# Altium schematic sheet LLR-05U (Secondary-Board-Schematic).SchDoc
size A4; SheetNumber: 1; SheetTotal: 1
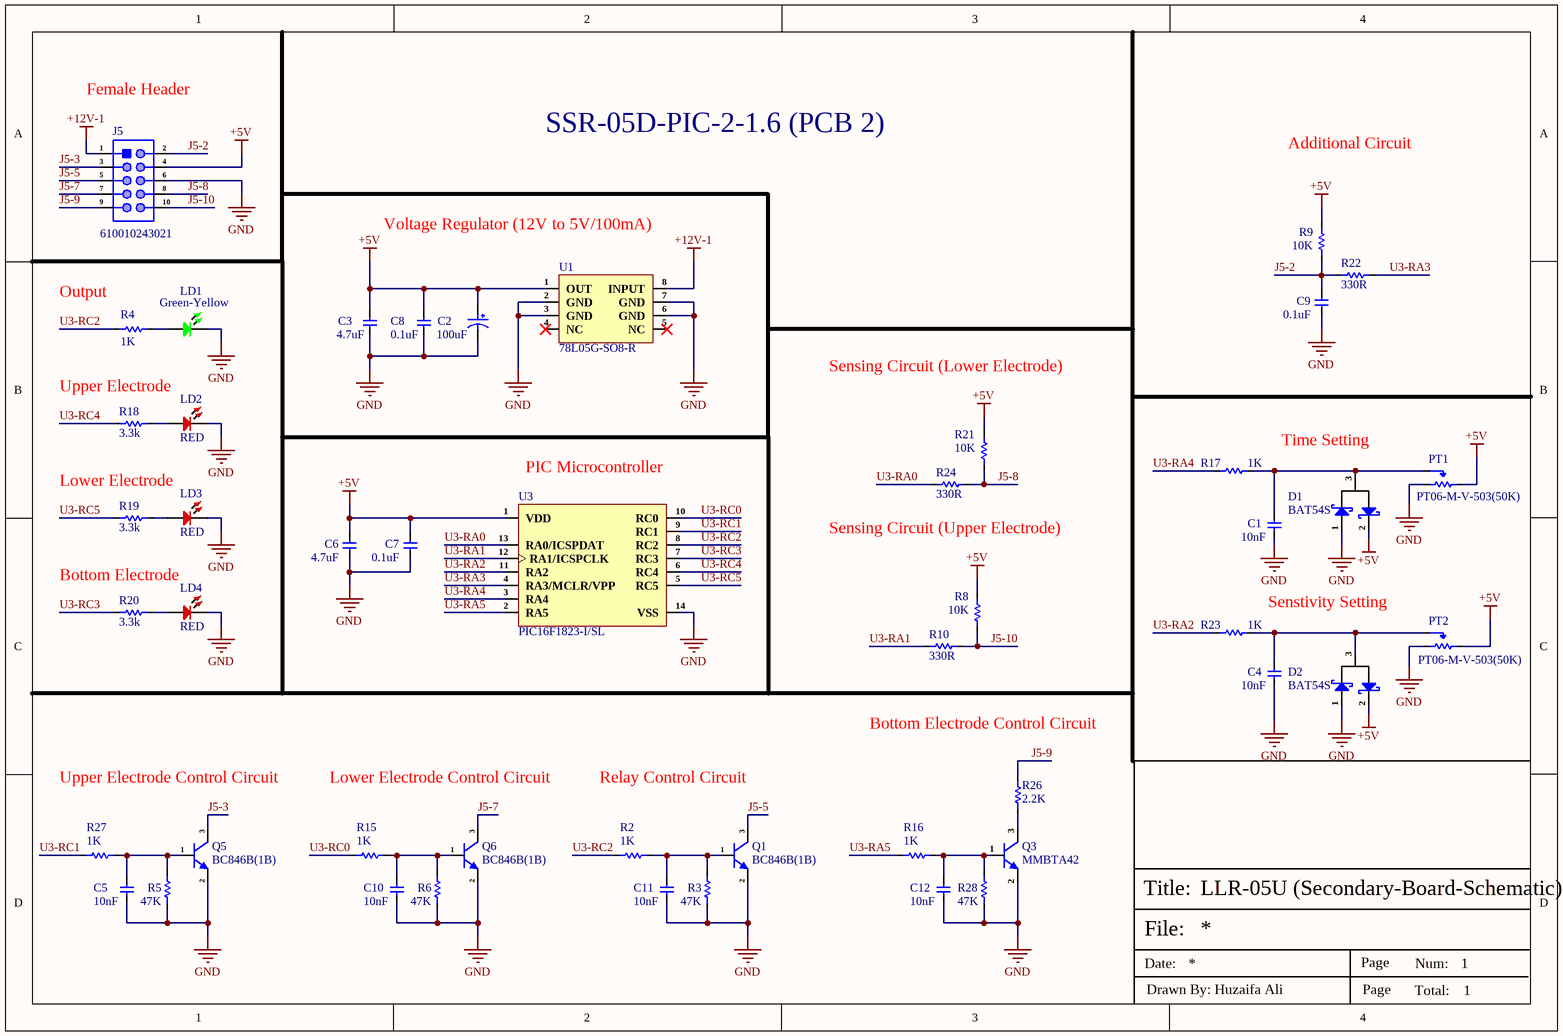
[diagram p0: LLR-05U (Secondary-Board-Schematic).SchDoc]

## Parts
C1  10nF  [Cap-0402]
C2  100uF  [RVT1A101M0605]
C3  4.7uF  [Cap-0603]
C4  10nF  [Cap-0402]
C5  10nF  [Cap-0402]
C6  4.7uF  [Cap-0603]
C7  0.1uF  [Cap-0603]
C8  0.1uF  [Cap-0603]
C9  0.1uF  [Cap-0603]
C10  10nF  [Cap-0402]
C11  10nF  [Cap-0402]
C12  10nF  [Cap-0402]
D1  BAT54S  [SOT-23]
D2  BAT54S  [SOT-23]
J5  610010243021  [610010243021]
LD1  Green-Yellow  [LED-0805]
LD2  RED  [LED-0805]
LD3  RED  [LED-0805]
LD4  RED  [LED-0805]
PT1  PT06-M-V-503(50K)  [PT06-M-V-503(50K)]
PT2  PT06-M-V-503(50K)  [PT06-M-V-503(50K)]
Q1  BC846B(1B)  [SOT-23]
Q3  MMBTA42  [SOT-23]
Q5  BC846B(1B)  [SOT-23]
Q6  BC846B(1B)  [SOT-23]
R2  1K  [Res-0603]
R3  47K  [Res-0603]
R4  1K  [Res-0603]
R5  47K  [Res-0603]
R6  47K  [Res-0603]
R8  10K  [Res-0603]
R9  10K  [Res-0603]
R10  330R  [Res-0603]
R15  1K  [Res-0603]
R16  1K  [Res-0603]
R17  1K  [Res-0603]
R18  3.3k  [Res-0603]
R19  3.3k  [Res-0603]
R20  3.3k  [Res-0603]
R21  10K  [Res-0603]
R22  330R  [Res-0603]
R23  1K  [Res-0603]
R24  330R  [Res-0603]
R26  2.2K  [Res-1206]
R27  1K  [Res-0603]
R28  47K  [Res-0603]
U1  78L05G-SO8-R  [SOP-8]
U3  PIC16F1823-I/SL  [SOIC-14]

## Nets
+5V: C2.1 C3.2 C6.2 C7.2 C8.2 D1.2(K) D2.2(K) J5.4 PT1.3(CW) PT2.3(CW) R8.2 R9.2 R21.2 U1.1(OUT) U3.1(VDD)
+12V-1: J5.1 U1.8(INPUT)
GND: C1.1 C2.2 C3.1 C4.1 C5.1 C6.1 C7.1 C8.1 C9.1 C10.1 C11.1 C12.1 D1.1(A) D2.1(A) J5.6 LD1.2 LD2.2 LD3.2 LD4.2 PT1.1(CCW) PT2.1(CCW) Q1.2(E) Q3.2(E) Q5.2(E) Q6.2(E) R3.1 R5.1 R6.1 R28.1 U1.2(GND) U1.3(GND) U1.6(GND) U1.7(GND) U3.14(VSS)
J5-2: C9.2 J5.2 R9.1 R22.2
J5-3: J5.3 Q5.3(C)
J5-5: J5.5 Q1.3(C)
J5-7: J5.7 Q6.3(C)
J5-8: J5.8 R21.1 R24.2
J5-9: J5.9 R26.2
J5-10: J5.10 R8.1 R10.2
U3-RA0: R24.1 U3.13(RA0/ICSPDAT)
U3-RA1: R10.1 U3.12(RA1/ICSPCLK)
U3-RA2: R23.2 U3.11(RA2)
U3-RA3: R22.1 U3.4(RA3/MCLR/VPP)
U3-RA4: R17.2 U3.3(RA4)
U3-RA5: R16.2 U3.2(RA5)
U3-RC0: R15.2 U3.10(RC0)
U3-RC1: R27.2 U3.9(RC1)
U3-RC2: R2.2 R4.2 U3.8(RC2)
U3-RC3: R20.1 U3.7(RC3)
U3-RC4: R18.1 U3.6(RC4)
U3-RC5: R19.1 U3.5(RC5)
NetC1_2: C1.2 D1.3(A/K) PT1.2(Wiper) R17.1
NetC4_2: C4.2 D2.3(A/K) PT2.2(Wiper) R23.1
NetC5_2: C5.2 Q5.1(B) R5.2 R27.1
NetC10_2: C10.2 Q6.1(B) R6.2 R15.1
NetC11_2: C11.2 Q1.1(B) R2.1 R3.2
NetC12_2: C12.2 Q3.1(B) R16.1 R28.2
NetLD1_1: LD1.1 R4.1
NetLD2_1: LD2.1 R18.2
NetLD3_1: LD3.1 R19.2
NetLD4_1: LD4.1 R20.2
NetQ3_3: Q3.3(C) R26.1

Not connected (* = marked no-connect by the designer): U1 4(NC)* 5(NC)*

## Notes on the sheet
- Female Header
- SSR-05D-PIC-2-1.6 (PCB 2)
- Additional Circuit
- Voltage Regulator (12V to 5V/100mA)
- (near R4) Output
- Sensing Circuit (Lower Electrode)
- Upper Electrode
- Time Setting
- Lower Electrode
- (near U3) PIC Microcontroller
- Bottom Electrode
- Sensing Circuit (Upper Electrode)
- Senstivity Setting
- Upper Electrode Control Circuit
- Lower Electrode Control Circuit
- Relay Control Circuit
- Bottom Electrode Control Circuit
- File:
- Title:
- Date:
- Page
- Num:
- Total:
- Drawn By: Huzaifa Ali

## Library data of the parts
C1 C4 C5 C10-C12 = CC0402KRX7R8BB103: CAP CER 10000PF 25V X7R 0402; Manufacturer: Yageo; Tolerance: 10%; Item Type: Capacitor; Supplier 1: Digi-Key; Manufacturer Part Number: CC0402KRX7R8BB103; Stock 1: 0; Pricing 1: 1=0.1, 10=0.021, 100=0.0093, 500=0.00666, 1000=0.00523, 2500=0.00476, 5000=0.00438 (USD); Mount: Surface Mount; Case/Package: 0402; Case Code (Metric): 1005; Case Code (Imperial): 0402; Min Operating Temperature: -55°C; Max Operating Temperature: 125°C; Capacitance: 10nF; Dielectric: X7R; Voltage Rating: 25V; Package Quantity: 1; Packaging: Tape and Reel; Voltage Rating (DC): 25V; Termination: SMD/SMT; Composition: Ceramic; Length: 1mm; Height: 0.5mm; Depth: 0.5mm; Width: 0.02inch; Thickness: 0.022inch; Radiation Hardening: No; REACH SVHC: Unknown; Lead Free: Lead Free; Halogen Free: Halogen Free; ComponentLink1URL: http://www.yageo.com/documents/recent/UPY-GPHC_X7R_6.3V-to-50V_18.pdf?src-supplier=Digi-Key; ComponentLink1Description: http://www.yageo.com/documents/recent/UPY-GPHC_X7R_6.3V-to-50V_18.pdf?src-supplier=Digi-Key; ComponentLink2URL: https://www.verical.com/server-webapp/html/getDatasheet?partID=375418&src-supplier=Verical; ComponentLink2Description: https://www.verical.com/server-webapp/html/getDatasheet?partID=375418&src-supplier=Verical; ComponentLink3URL: http://www.yageo.com/documents/recent/UPY-GPHC_X7R_6.3V-to-50V_8.pdf?src-supplier=Avnet; ComponentLink3Description: http://www.yageo.com/documents/recent/UPY-GPHC_X7R_6.3V-to-50V_8.pdf?src-supplier=Avnet; ComponentLink4URL: https://4donline.ihs.com/images/VipMasterIC/IC/YAGO/YAGO-S-A0003557223/YAGO-S-A0003557223-1.pdf?hkey=52A5661711E402568146F3353EA87419&src-supplier=Element14; ComponentLink4Description: https://4donline.ihs.com/images/VipMasterIC/IC/YAGO/YAGO-S-A0003557223/YAGO-S-A0003557223-1.pdf?hkey=52A5661711E402568146F3353EA87419&src-supplier=Element14; ComponentLink5URL: http://www.farnell.com/datasheets/2167236.pdf?src-supplier=Element14; ComponentLink5Description: http://www.farnell.com/datasheets/2167236.pdf?src-supplier=Element14; ComponentLink6URL: http://www.mouser.com/ds/2/447/Yageo_UPY-GP_NP0_16V-to-50V_9-358835.pdf?src-supplier=Mouser; ComponentLink6Description: http://www.mouser.com/ds/2/447/Yageo_UPY-GP_NP0_16V-to-50V_9-358835.pdf?src-supplier=Mouser; Supplier Part Number 1: 311-1337-1-ND; LCSC Part Number: C327025
C2 = RVT1A101M0605: 100uF 10V 55mA@120Hz ±20% SMD,D6.3xL5.4mm Aluminum Electrolytic Capacitors - SMD ROHS; Manufacturer: ROQANG; Manufacturer Part Number: RVT1A101M0605; Package: SMD,D6.3xL5.4mm; LCSC Part Number: C72474; Item Type: Capacitor; ComponentLink1Description: LCSC; ComponentLink1URL: https://www.lcsc.com/product-detail/Aluminum-Electrolytic-Capacitors-SMD_ROQANG-RVT1A101M0605_C72474.html
C3 C6 = GRM188R61E475KE11D: CAP CER 4.7UF 25V X5R 0603; Manufacturer: Murata; Material: Ceramic; Tolerance: 10%; Supplier 1: Digi-Key; Manufacturer Part Number: GRM188R61E475KE11D; Stock 1: 71618; Pricing 1: 1=0.37, 10=0.258, 100=0.1549, 500=0.1162, 1000=0.09812 (USD); Mount: Surface Mount; Case/Package: 0603; Case Code (Metric): 1608; Case Code (Imperial): 0603; Min Operating Temperature: -55°C; Max Operating Temperature: 85°C; Package Quantity: 4000; Packaging: Cut Tape; Capacitance: 4.7uF; Voltage Rating: 25V; Dielectric: X5R; Voltage: 25V; Voltage Rating (DC): 25V; Length: 1.6mm; Height: 0.8mm; Width: 0.031inch; Thickness: 0.031inch; Depth: 0.8mm; REACH SVHC: No SVHC; Lead Free: Lead Free; ComponentLink1URL: http://www.farnell.com/datasheets/2048165.pdf?src-supplier=Element14; ComponentLink1Description: http://www.farnell.com/datasheets/2048165.pdf?src-supplier=Element14; ComponentLink2URL: https://www.murata.com/~/media/webrenewal/support/library/catalog/products/capacitor/mlcc/c02e.ashx?la=en-us&src-supplier=Digi-Key; ComponentLink2Description: https://www.murata.com/~/media/webrenewal/support/library/catalog/products/capacitor/mlcc/c02e.ashx?la=en-us&src-supplier=Digi-Key; Supplier Part Number 1: 490-7203-1-ND; LCSC Part Number: C90057
C7-C9 = CL10B104KB8WPNC: CAP CER 0.1UF 50V X7R 0603; Item Type: Capacitor; Material: 4241ConductorMaterial; Value: 100nF; Tolerance: 10%; LCSC Part Number: C307348; ComponentLink1Description: LCSC; Supplier: Rs; Supplier Part Number: 2575919; RoHS: Yes; Category: Ceramic Capacitors; Stock: 400; Pricing: 100=0.021, 500=0.019, 1000=0.015, 2000=0.01 (GBP); Mounting Technology: Surface Mount; Case/Package: 0603; Case Code (Metric): 1608; Case Code (Imperial): 0603; Min Operating Temperature: -55°C; Max Operating Temperature: 125°C; Packaging: Cut Tape; Voltage Rating: 50V; Series: CL; Voltage Rating (DC): 50V; Height: 900um; Ratings: AEC-Q200; RoHS Compliant: Yes; Lead Free: 5697LeadFree; ComponentLink2URL: http://www.farnell.com/datasheets/2710560.pdf?src-supplier=Farnell; ComponentLink2Description: http://www.farnell.com/datasheets/2710560.pdf?src-supplier=Farnell; ComponentLink3URL: http://www.samsungsem.com/kr/support/product-search/mlcc/CL10B104KB8WPNC.jsp?src-supplier=Digi-Key; ComponentLink3Description: http://www.samsungsem.com/kr/support/product-search/mlcc/CL10B104KB8WPNC.jsp?src-supplier=Digi-Key; ComponentLink4URL: http://www.farnell.com/datasheets/2710560.pdf?src-supplier=Element14; ComponentLink4Description: http://www.farnell.com/datasheets/2710560.pdf?src-supplier=Element14; ComponentLink5URL: https://datasheet.octopart.com/CL10B104KB8WPNC-Samsung-Electro-Mechanics-datasheet-120093645.pdf?src-supplier=Future+Electronics; ComponentLink5Description: https://datasheet.octopart.com/CL10B104KB8WPNC-Samsung-Electro-Mechanics-datasheet-120093645.pdf?src-supplier=Future+Electronics; ComponentLink6URL: http://www.farnell.com/datasheets/2710560.pdf?src-supplier=Newark; ComponentLink6Description: http://www.farnell.com/datasheets/2710560.pdf?src-supplier=Newark; ComponentLink7URL: http://www.samsungsem.com/servlet/FileDownload?type=spec&file=CL10B104KB8WPNC.pdf&src-supplier=Avnet; ComponentLink7Description: http://www.samsungsem.com/servlet/FileDownload?type=spec&file=CL10B104KB8WPNC.pdf&src-supplier=Avnet; ComponentLink8URL: https://datasheet.octopart.com/CL10B104KB8WPNC-Samsung-datasheet-8326407.pdf?src-supplier=TME; ComponentLink8Description: https://datasheet.octopart.com/CL10B104KB8WPNC-Samsung-datasheet-8326407.pdf?src-supplier=TME
D1 D2 = BAT54S: 30V Dual 200mA 800mV@100mA SOT-23 Schottky Barrier Diodes (SBD) ROHS; Manufacturer: JSMSEMI; Item Type: Diode; Manufacturer Part Number: BAT54S; Package: SOT-23; LCSC Part Number: C916425; ComponentLink1Description: LCSC; ComponentLink1URL: https://www.lcsc.com/product-detail/Schottky-Barrier-Diodes-SBD_JSMSEMI-BAT54S_C916425.html
J5 = 610010243021: SMT Vertical Socket Header WR-PHD, Pitch 2.54 mm, Dual Row, 10 pins; Manufacturer: Wurth Electronics; Item Type: Female Header; Supplier: Farnell; Supplier Part Number: 2827934; Manufacturer Part Number: 610010243021; RoHS: Yes; Stock: 117; Pricing: 1=1.86, 10=1.41, 100=1.22, 250=1.12, 500=1.05, 1000=0.972 (GBP); RoHS Compliant: Yes; LCSC Part Number: C6848484
LD1 = XL-2012SYGC: 0805 普绿色 (Iv=26-75mcd(Typ) @IF=5mA); Manufacturer: XINGLIGHT; Item Type: LED; Supplier: LCSC; LCSC Part Number: C965816; Manufacturer Part Number: XL-2012SYGC; RoHS: No
LD2-LD4 = NCD0805R1: 20mA 无色透明透镜 67mcd~195mcd -30℃~+85℃ 615nm~630nm 独立二极管 Red 130° 65mW 1.6V~2.6V 0805 Light Emitting Diodes (LED) ROHS; Manufacturer: FOSHAN Nationstar Optoelectronics; Supplier: LCSC; LCSC Part Number: C84256; Manufacturer Part Number: NCD0805R1; RoHS: No; Item Type: LED
PT1 PT2 = PT06-M-V-503(50K): 20% 150mW 50kΩ - Variable Resistors/Potentiometers ROHS; Manufacturer: BOCHEN; Manufacturer Part Number: PT06-M-V-503(50K); Package: Custom; LCSC Part Number: C5205067; Item Type: Potentiometer; ComponentLink1Description: LCSC; ComponentLink1URL: https://www.lcsc.com/product-detail/Variable-span-style-background-color-ff0-Resistors-span-Potentiometers_BOCHEN-Chengdu-Guosheng-Tech-PT10-M-V-503-50K_C5205087.html
Q1 Q5 Q6 = BC846B(1B): 65V 300mW 200@2mA,5V 100mA NPN SOT-23 Bipolar Transistors - BJT ROHS; Manufacturer: ST(Semtech); Manufacturer Part Number: BC846B(1B); Package: SOT-23; LCSC Part Number: C118727; Item Type: Transistor; ComponentLink1Description: LCSC; ComponentLink1URL: https://www.lcsc.com/product-detail/Transistors-NPN-PNP_ST-Semtech-BC846B-1B_C118727.html
Q3 = MMBTA42: 300V 350mW 100@10mA,10V 300mA NPN SOT-23 Bipolar Transistors - BJT ROHS; Manufacturer: Guangdong Hottech; Manufacturer Part Number: MMBTA42; Package: SOT-23; LCSC Part Number: C181172; Item Type: Transistor; ComponentLink1Description: LCSC; ComponentLink1URL: https://www.lcsc.com/product-detail/Bipolar-Transistors-BJT_Guangdong-Hottech-MMBTA42_C181172.html
R2 R4 R15-R17 R23 R27 = RT0603BRD071KL: RES SMD 1K OHM 0.1% 1/10W 0603; Manufacturer: Yageo; Resistance: 1kR; Power Rating: 100mW; Voltage Rating: 75V; Temperature Coefficient: 25ppm/°C; Voltage Rating (DC): 50V; Item Type: Resistor; Supplier 1: Arrow Electronics; Manufacturer Part Number: RT0603BRD071KL; RoHS: Yes; Category: Chip SMD Resistors; Stock 1: 130000; Pricing 1: 5000=0.03900, 10000=0.03450, 25000=0.03070, 50000=0.02040 (USD); Mount: Surface Mount; Case/Package: 0603; Case Code (Metric): 1608; Case Code (Imperial): 0603; Contact Plating: Tin,Lead; Size Code: 0603; Min Operating Temperature: -55°C; Max Operating Temperature: 125°C; Package Quantity: 5000; Packaging: Tape and Reel; Resistor Type: Thin Film; Number of Terminations: 2; Termination: SMD/SMT; Max Power Dissipation: 100mW; Features: Moisture Resistant; Series: RT; Technology: THIN FILM; Construction: Rectangular; Length: 1.6mm; Width: 0.031inch; Height: 0.022inch; Depth: 0.8mm; Military Standard: Not; Lead Free: Lead Free; RoHS Compliant: Yes; ComponentLink1URL: https://datasheet.ciiva.com/11819/0900766b8079c86e-11819652.pdf?src-supplier=RSComponents; ComponentLink1Description: https://datasheet.ciiva.com/11819/0900766b8079c86e-11819652.pdf?src-supplier=RSComponents; ComponentLink2URL: https://datasheet.ciiva.com/5624/pyu-rt-1-to-0-05-rohs-l-4-5624759.pdf?src-supplier=Mouser; ComponentLink2Description: https://datasheet.ciiva.com/5624/pyu-rt-1-to-0-05-rohs-l-4-5624759.pdf?src-supplier=Mouser; ComponentLink3URL: https://datasheet.ciiva.com/29718/pyu-rt-1-to-0-05-rohs-l-4-29718010.pdf?src-supplier=Digi-Key; ComponentLink3Description: https://datasheet.ciiva.com/29718/pyu-rt-1-to-0-05-rohs-l-4-29718010.pdf?src-supplier=Digi-Key; ComponentLink4URL: https://datasheet.ciiva.com/29718/pyu-rt-1-to-0-05-rohs-l-4-29718011.pdf?src-supplier=Digi-Key; ComponentLink4Description: https://datasheet.ciiva.com/29718/pyu-rt-1-to-0-05-rohs-l-4-29718011.pdf?src-supplier=Digi-Key; Supplier Part Number 1: RT0603BRD071KL; LCSC Part Number: C110776
R3 R5 R6 R28 = RT0603BRD0747KL: RES SMD 47K OHM 0.1% 1/10W 0603; Manufacturer: Yageo; Voltage Rating: 75V; Resistance: 47kR; Power Rating: 100mW; Temperature Coefficient: 25ppm/°C; Voltage Rating (DC): 50V; Item Type: Resistor; Supplier 1: Arrow Electronics; Manufacturer Part Number: RT0603BRD0747KL; RoHS: Yes; Category: Chip SMD Resistors; Stock 1: 5153; Pricing 1: 1=0.29190, 10=0.22910, 25=0.22680, 100=0.09530, 250=0.09440, 500=0.09340, 1000=0.04780, 3000=0.03070 (USD); Case/Package: 0603; Case Code (Metric): 1608; Case Code (Imperial): 0603; Contact Plating: Tin,Lead; Min Operating Temperature: -55°C; Max Operating Temperature: 125°C; Packaging: Tape and Reel; Package Quantity: 5000; Resistor Type: Thin Film; Termination: SMD/SMT; Number of Terminations: 2; Max Power Dissipation: 100mW; Features: Moisture Resistant; Series: RT; Construction: Rectangular; Length: 0.063inch; Width: 0.031inch; Height: 0.022inch; Depth: 0.8mm; Military Standard: Not; Lead Free: Lead Free; RoHS Compliant: Yes; ComponentLink1URL: https://datasheet.ciiva.com/2585/pyu-rt-1-to-0-05-rohs-l-4-2585964.pdf?src-supplier=Digi-Key; ComponentLink1Description: https://datasheet.ciiva.com/2585/pyu-rt-1-to-0-05-rohs-l-4-2585964.pdf?src-supplier=Digi-Key; ComponentLink2URL: https://datasheet.ciiva.com/46635/pyu-rt-1-to-0-05-rohs-l-5-46635309.pdf?src-supplier=Digi-Key; ComponentLink2Description: https://datasheet.ciiva.com/46635/pyu-rt-1-to-0-05-rohs-l-5-46635309.pdf?src-supplier=Digi-Key; Supplier Part Number 1: RT0603BRD0747KL; LCSC Part Number: C326725
R8 R9 R21 = RC0603FR-0710KL: RES SMD 10K Ohm 1% 1/10W 0603; Manufacturer: Yageo; Resistance: 10kR; Temperature Coefficient: 100ppm/°C; Voltage Rating (DC): 50V; Power Rating: 100mW; Voltage Rating: 75V; Item Type: Resistor; Supplier 1: Digi-Key; Manufacturer Part Number: RC0603FR-0710KL; RoHS: Yes; Category: Chip SMD Resistors; Stock 1: 25249139; Pricing 1: 1=0.10000, 10=0.02400, 100=0.00970, 1000=0.00436, 2500=0.00378 (USD); Case/Package: 0603; Number of Pins: 2; Case Code (Imperial): 0603; Case Code (Metric): 1608; Weight: 7.1E-05oz; Size Code: 0603; Min Operating Temperature: -55°C; Max Operating Temperature: 155°C; Tolerance: 1%; Resistor Type: Thick Film; Packaging: Tape and Reel; Termination: SMD/SMT; Features: Moisture Resistant; Series: RC; Max Power Dissipation: 100mW; Number of Terminations: 2; Resistance Tolerance: 1%; Construction: Rectangular; Length: 1.6mm; Width: 0.8mm; Height: 0.45mm; Depth: 0.8mm; Lead Pitch: 0.3mm; REACH SVHC: Unknown; Lead Free: Lead Free; Military Standard: Not; RoHS Compliant: Yes; ComponentLink1URL: https://datasheet.ciiva.com/7660/38590-7660789.pdf?src-supplier=Element14; ComponentLink1Description: https://datasheet.ciiva.com/7660/38590-7660789.pdf?src-supplier=Element14; ComponentLink2URL: https://datasheet.ciiva.com/7983/443971-7983596.pdf?src-supplier=Element14; ComponentLink2Description: https://datasheet.ciiva.com/7983/443971-7983596.pdf?src-supplier=Element14; ComponentLink3URL: https://datasheet.ciiva.com/22747/443971-22747519.pdf?src-supplier=Element14; ComponentLink3Description: https://datasheet.ciiva.com/22747/443971-22747519.pdf?src-supplier=Element14; ComponentLink4URL: https://datasheet.ciiva.com/46440/1868787-46440891.pdf?src-supplier=Element14; ComponentLink4Description: https://datasheet.ciiva.com/46440/1868787-46440891.pdf?src-supplier=Element14; ComponentLink5URL: https://datasheet.ciiva.com/7746/1738695-7746239.pdf?src-supplier=Element14; ComponentLink5Description: https://datasheet.ciiva.com/7746/1738695-7746239.pdf?src-supplier=Element14; ComponentLink6URL: https://datasheet.ciiva.com/15189/getdatasheetpartid-409289-15189591.pdf?src-supplier=Verical; ComponentLink6Description: https://datasheet.ciiva.com/15189/getdatasheetpartid-409289-15189591.pdf?src-supplier=Verical; Supplier Part Number 1: 311-10.0KHRCT-ND; LCSC Part Number: C98220
R10 R22 R24 = 0603WAF3300T5E: 100mW Thick Film Resistors 75V ±100ppm/℃ ±1% 330Ω 0603 Chip Resistor - Surface Mount ROHS; Manufacturer: Royal Electronic Factory; Supplier: Mouser; Supplier Part Number: 303-0603WAF3300T5E; Manufacturer Part Number: 0603WAF3300T5E; RoHS: No; Item Type: Resistor; Stock: 210000; Pricing: 10000=0.001 (USD); Value: 330R; LCSC Part Number: C23138
R18-R20 = RT0603BRD073K3L: RES SMD 3.3K OHM 0.1% 1/10W 0603; Manufacturer: Yageo; Resistance: 3.3kR; Power Rating: 100mW; Voltage Rating: 75V; Temperature Coefficient: 25ppm/°C; Voltage Rating (DC): 50V; Item Type: Resistor; Supplier 1: Arrow Electronics; Manufacturer Part Number: RT0603BRD073K3L; RoHS: Yes; Category: Chip SMD Resistors; Stock 1: 2417; Pricing 1: 1=0.30610, 10=0.21080, 25=0.17430, 100=0.09180, 250=0.09000, 500=0.07600, 1000=0.04220 (USD); Case/Package: 0603; Case Code (Metric): 1608; Case Code (Imperial): 0603; Contact Plating: Tin,Lead; Min Operating Temperature: -55°C; Max Operating Temperature: 125°C; Package Quantity: 5000; Packaging: Tape and Reel; Tolerance: 0.1%; Resistor Type: Thin Film; Number of Terminations: 2; Termination: SMD/SMT; Max Power Dissipation: 100mW; Features: Moisture Resistant; Series: RT; Construction: Rectangular; Length: 0.063inch; Width: 0.031inch; Height: 0.022inch; Depth: 0.8mm; Military Standard: Not; Lead Free: Lead Free; RoHS Compliant: Yes; ComponentLink1URL: https://datasheet.ciiva.com/11814/0900766b8027bd26-11814026.pdf?src-supplier=Rs; ComponentLink1Description: https://datasheet.ciiva.com/11814/0900766b8027bd26-11814026.pdf?src-supplier=Rs; ComponentLink2URL: https://datasheet.ciiva.com/12694/pyu-rt-1-to-0-05-rohs-l-4-12694839.pdf?src-supplier=Mouser; ComponentLink2Description: https://datasheet.ciiva.com/12694/pyu-rt-1-to-0-05-rohs-l-4-12694839.pdf?src-supplier=Mouser; ComponentLink3URL: https://datasheet.ciiva.com/2585/pyu-rt-1-to-0-05-rohs-l-4-2585926.pdf?src-supplier=Digi-Key; ComponentLink3Description: https://datasheet.ciiva.com/2585/pyu-rt-1-to-0-05-rohs-l-4-2585926.pdf?src-supplier=Digi-Key; Supplier Part Number 1: RT0603BRD073K3L; LCSC Part Number: C309653
R26 = 1206W4F2201T5E: 250mW Thick Film Resistors 200V ±100ppm/℃ ±1% 2.2kΩ 1206 Chip Resistor - Surface Mount ROHS; Manufacturer: Uniroyal; Supplier: LCSC; LCSC Part Number: C17948; Manufacturer Part Number: 1206W4F2201T5E; RoHS: Yes; Category: LDO; RoHS Compliant: Yes; Item Type: Resistor
U1 = 78L05G-SO8-R: Pos 5V 0.1A 8-Pin SOP T/R; Manufacturer: Unisonic; Item Type: IC; Manufacturer Part Number: 78L05G-SO8-R; Package: SOP-8; LCSC Part Number: -; ComponentLink1Description: Chipsmall; ComponentLink1URL: https://www.chipsmall.com/Products/78L05G-SO8-R_35000047.html
U3 = PIC16F1823-I/SL: IC MCU 8BIT 3.5KB FLASH 14SOIC; Manufacturer: Microchip; Item Type: Microprocessors; Supplier: Digikey; Supplier Part Number: PIC16F1823-I/SL-ND; Manufacturer Part Number: PIC16F1823-I/SL; RoHS: Yes; Stock: 47700; Pricing: 1=1.4, 25=1.28, 100=1.18 (USD); ComponentLink1URL: https://datasheet.ciiva.com/22671/1645109-22671365.pdf?src-supplier=Element14; ComponentLink1Description: https://datasheet.ciiva.com/22671/1645109-22671365.pdf?src-supplier=Element14; ComponentLink2URL: https://datasheet.ciiva.com/14132/pic12f1822-16f1823-eng-tds-14132380.pdf?src-supplier=Distrelec; ComponentLink2Description: https://datasheet.ciiva.com/14132/pic12f1822-16f1823-eng-tds-14132380.pdf?src-supplier=Distrelec; ComponentLink3URL: https://datasheet.ciiva.com/6641/41413c-6641949.pdf?src-supplier=Digikey; ComponentLink3Description: https://datasheet.ciiva.com/6641/41413c-6641949.pdf?src-supplier=Digikey; ComponentLink4URL: https://datasheet.ciiva.com/9229/41414d-9229034.pdf?src-supplier=Avnet; ComponentLink4Description: https://datasheet.ciiva.com/9229/41414d-9229034.pdf?src-supplier=Avnet; ComponentLink5URL: https://datasheet.ciiva.com/29331/651599-da-01-en-ic-mcu-pic16f1823-i-sl-soic-14-mcp-29331420.pdf?src-supplier=Conrad; ComponentLink5Description: https://datasheet.ciiva.com/29331/651599-da-01-en-ic-mcu-pic16f1823-i-sl-soic-14-mcp-29331420.pdf?src-supplier=Conrad